# Altium schematic sheet Connector_Section.SchDoc
size A4; DocumentNumber: 6; SheetNumber: 6; SheetTotal: 6
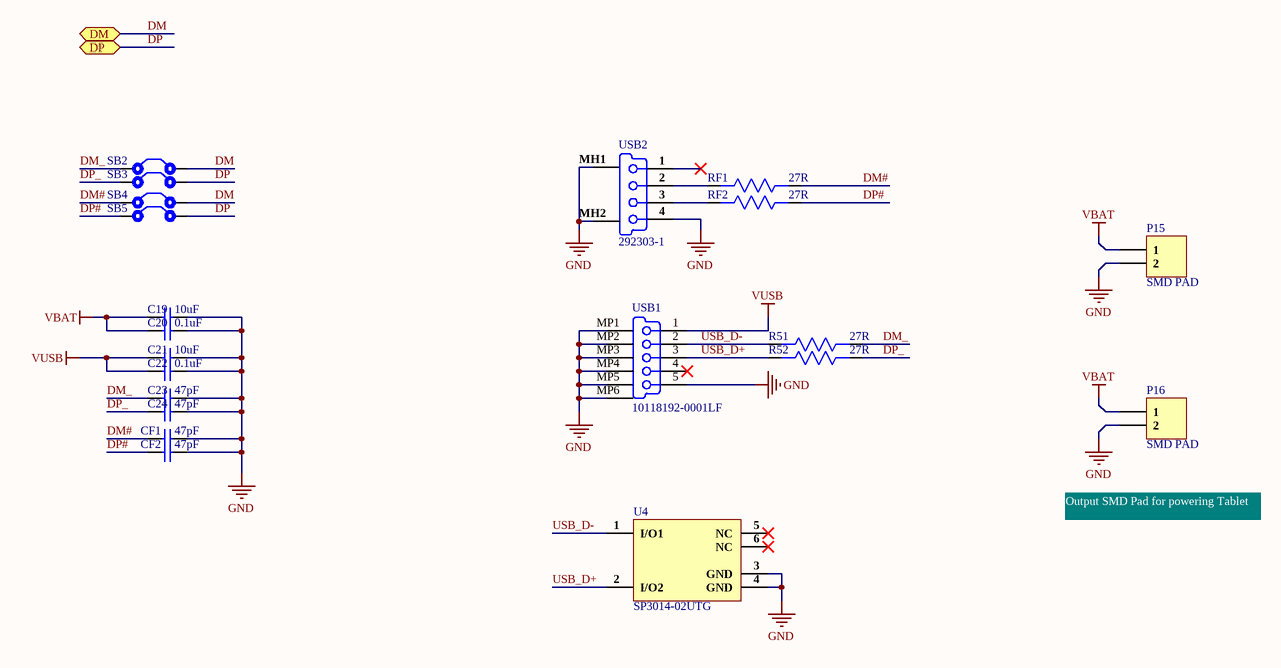
[diagram p0: Connector_Section.SchDoc]

## Parts
C19  10uF  [Cap0402]
C20  0.1uF  [Cap0402]
C21  10uF  [Cap0402]
C22  0.1uF  [Cap0402]
C23  47pF  [Cap0402]
C24  47pF  [Cap0402]
CF1  47pF  [Cap0402]
CF2  47pF  [Cap0402]
P15  SMD PAD  [Solder Bridge]
P16  SMD PAD  [Solder Bridge]
R51  27R  [Res0402]
R52  27R  [Res0402]
RF1  27R  [Res0402]
RF2  27R  [Res0402]
SB2  Solder Bridge  [Solder Bridge]  (value not drawn)
SB3  Solder Bridge  [Solder Bridge]  (value not drawn)
SB4  Solder Bridge  [Solder Bridge]  (value not drawn)
SB5  Solder Bridge  [Solder Bridge]  (value not drawn)
U4  SP3014-02UTG  [SP3014-02UTG]
USB1  10118192-0001LF  [Micro Usb Conn SMD]
USB2  292303-1  [292303-1]

## Ports
DM (bidir), DP (bidir)

## Nets
GND: C19.2 C20.2 C21.2 C22.2 C23.2 C24.2 CF1.2 CF2.2 P15.2 P16.2 U4.3(GND) U4.4(GND) USB1.5(GND) USB1.MP1(Tab) USB1.MP2(Tab) USB1.MP3(Tab) USB1.MP4(Tab) USB1.MP5(Tab) USB1.MP6(Tab) USB2.4(NC) USB2.MH1(Tab) USB2.MH2(Tab)
VBAT: C19.1 C20.1 P15.1 P16.1
VUSB: C21.1 C22.1 USB1.1(V_BUS_(5V))
DM: SB2.2 SB4.2 ; port DM
DM#: CF1.1 RF1.1 SB4.1
DM_: C23.1 R51.1 SB2.1
DP: SB3.2 SB5.2 ; port DP
DP#: CF2.1 RF2.1 SB5.1
DP_: C24.1 R52.1 SB3.1
USB_D+: R52.2 U4.2(I/O2) USB1.3(D+)
USB_D-: R51.2 U4.1(I/O1) USB1.2(D-)
NetRF1_2: RF1.2 USB2.2(D-)
NetRF2_2: RF2.2 USB2.3(D+)

Not connected (* = marked no-connect by the designer): U4 5(NC)* 6(NC)*; USB1 4(NC)*; USB2 1(V_BUS_(5V))*

## Notes on the sheet
- Output SMD Pad for powering Tablet

## Library data of the parts
C19 C21 = CL05A106MP8NUB8: CAP CER 10UF 10V X5R 0402; Manufacturer: Samsung; Tolerance: 20%; Supplier 1: Digi-Key; Manufacturer Part Number: CL05A106MP8NUB8; Stock 1: 1792112; Pricing 1: 1=0.4, 10=0.278, 50=0.1948, 100=0.167, 500=0.12528, 1000=0.1058, 2500=0.10023 (USD); Mount: Surface Mount; Case/Package: 0402; Case Code (Metric): 1005; Case Code (Imperial): 0402; Min Operating Temperature: -55°C; Max Operating Temperature: 85°C; Packaging: Tape and Reel; Capacitance: 10uF; Voltage Rating: 10V; Length: 0.039inch; Width: 0.02inch; Thickness: 0.035inch; ComponentLink1URL: http://www.samsungsem.com/kr/support/product-search/mlcc/CL05A106MP8NUB8.jsp?src-supplier=Digi-Key; ComponentLink1Description: http://www.samsungsem.com/kr/support/product-search/mlcc/CL05A106MP8NUB8.jsp?src-supplier=Digi-Key; Supplier Part Number 1: 1276-6830-1-ND
C20 C22 = CC0402KRX7R7BB104: CAP CER 0.1UF 16V X7R 0402; Manufacturer: Yageo; Tolerance: 10%; Capacitance: 100nF; Supplier 1: Digi-Key; Manufacturer Part Number: CC0402KRX7R7BB104; Stock 1: 16982736; Pricing 1: 1=0.1, 10=0.034, 100=0.015, 500=0.0107, 1000=0.00841, 2500=0.00764, 5000=0.00703 (USD); Mount: Surface Mount; Case/Package: 0402; Number of Pins: 2; Case Code (Metric): 1005; Case Code (Imperial): 0402; Min Operating Temperature: -55°C; Max Operating Temperature: 125°C; Dielectric: X7R; Voltage Rating: 16V; Voltage Rating (DC): 16V; Packaging: Tape and Reel; Package Quantity: 1; Termination: SMD/SMT; Composition: Ceramic; Voltage: 16V; Length: 1mm; Height: 0.5mm; Width: 0.02inch; Thickness: 0.022inch; Depth: 0.5mm; Radiation Hardening: No; REACH SVHC: No SVHC; Lead Free: Lead Free; Halogen Free: Halogen Free; ComponentLink1URL: http://www.yageo.com/documents/recent/UPY-GPHC_X7R_6.3V-to-50V_8.pdf?src-supplier=Avnet+Europe; ComponentLink1Description: http://www.yageo.com/documents/recent/UPY-GPHC_X7R_6.3V-to-50V_8.pdf?src-supplier=Avnet+Europe; ComponentLink2URL: http://www.yageo.com/documents/recent/UPY-GPHC_X7R_6.3V-to-50V_18.pdf?src-supplier=Digi-Key; ComponentLink2Description: http://www.yageo.com/documents/recent/UPY-GPHC_X7R_6.3V-to-50V_18.pdf?src-supplier=Digi-Key; ComponentLink3URL: http://www.yageo.com/documents/recent/UPY-GPHC_X7R_6.3V-to-50V_8.pdf?src-supplier=Avnet; ComponentLink3Description: http://www.yageo.com/documents/recent/UPY-GPHC_X7R_6.3V-to-50V_8.pdf?src-supplier=Avnet; ComponentLink4URL: http://www.yageo.com/documents/recent/UPY-GPHC_X7R_6.3V-to-50V_18.pdf?src-supplier=Mouser; ComponentLink4Description: http://www.yageo.com/documents/recent/UPY-GPHC_X7R_6.3V-to-50V_18.pdf?src-supplier=Mouser; ComponentLink5URL: http://www.farnell.com/datasheets/2167236.pdf?src-supplier=Element14; ComponentLink5Description: http://www.farnell.com/datasheets/2167236.pdf?src-supplier=Element14; ComponentLink6URL: http://www.farnell.com/datasheets/1489800.pdf?src-supplier=Element14; ComponentLink6Description: http://www.farnell.com/datasheets/1489800.pdf?src-supplier=Element14; Supplier Part Number 1: 311-1338-1-ND
C23 C24 CF1 CF2 = GCM1555C1H470JA16D: CAP CER 47PF 50V C0G/NP0 0402; Manufacturer: Murata; Tolerance: 5%; Supplier 1: Digi-Key; Manufacturer Part Number: GCM1555C1H470JA16D; Stock 1: 692165; Pricing 1: 1=0.1, 10=0.059, 50=0.0324, 100=0.0265, 500=0.01892, 1000=0.01487, 2500=0.01352, 5000=0.01244 (USD); Mount: Surface Mount; Case/Package: 0402; Case Code (Metric): 1005; Case Code (Imperial): 0402; Min Operating Temperature: -55°C; Max Operating Temperature: 125°C; Packaging: Cut Tape; Capacitance: 47pF; Voltage Rating: 50V; Length: 0.039inch; Width: 0.02inch; Thickness: 0.022inch; Ratings: AEC-Q200; Lead Free: Lead Free; ComponentLink1URL: https://www.murata.com/~/media/webrenewal/support/library/catalog/products/capacitor/mlcc/c03e.ashx?la=en-us&src-supplier=Digi-Key; ComponentLink1Description: https://www.murata.com/~/media/webrenewal/support/library/catalog/products/capacitor/mlcc/c03e.ashx?la=en-us&src-supplier=Digi-Key; ComponentLink2URL: http://www.mouser.com/ds/2/281/c03e-806517.pdf?src-supplier=Mouser; ComponentLink2Description: http://www.mouser.com/ds/2/281/c03e-806517.pdf?src-supplier=Mouser; ComponentLink3URL: http://psearch.en.murata.com/capacitor/product/GCM1555C1H470JA16%23.pdf?src-supplier=Avnet; ComponentLink3Description: http://psearch.en.murata.com/capacitor/product/GCM1555C1H470JA16%23.pdf?src-supplier=Avnet; Supplier Part Number 1: 490-10670-1-ND
P15 P16 = SMD PAD: Wire connecting Pads
R51 R52 RF1 RF2 = RT0402FRE0727RL: RES SMD 27 OHM 1% 1/16W 0402; Manufacturer: Yageo; Power Rating: 62.5mW; Voltage Rating: 50V; Max Power Dissipation: 63mW; Temperature Coefficient: 50ppm/°C; Supplier 1: Digi-Key; Manufacturer Part Number 1: RT0402FRE0727RL; Stock 1: 26946; Pricing 1: 1=0.1, 10=0.072, 100=0.0277, 1000=0.0122, 2500=0.0105, 5000=0.0094 (USD); Case/Package: 0402; Case Code (Metric): 1005; Case Code (Imperial): 0402; Min Operating Temperature: -55°C; Max Operating Temperature: 125°C; Resistance: 27R; Tolerance: 1%; Packaging: Tape and Reel; Package Quantity: 10000; Composition: Thin Film; Number of Terminations: 2; Termination: SMD/SMT; Military Standard: Not; Voltage Rating (DC): 50V; Features: Moisture Resistant; Length: 1mm; Height: 0.014inch; Width: 0.02inch; Depth: 0.5mm; Lead Free: Lead Free; ComponentLink1URL: http://www.yageo.com/NewPortal/yageodocoutput?fileName=/pdf/R-Chip/PYu-RT_1-to-0.05_RoHS_L_5.pdf&src-supplier=Digi-Key; ComponentLink1Description: http://www.yageo.com/NewPortal/yageodocoutput?fileName=/pdf/R-Chip/PYu-RT_1-to-0.05_RoHS_L_5.pdf&src-supplier=Digi-Key; ComponentLink2URL: http://www.mouser.com/ds/2/447/yageodocoutput-1125656.pdf?src-supplier=Mouser; ComponentLink2Description: http://www.mouser.com/ds/2/447/yageodocoutput-1125656.pdf?src-supplier=Mouser; Supplier Part Number 1: YAG3343CT-ND
SB2-SB5 = Solder Bridge: Solder Bridge ON
U4 = SP3014-02UTG: TVS DIODE 5V 6.8V 6UDFN; Manufacturer: Littelfuse; Capacitance: 1E-12F; Number of Bidirectional Channels: 2; Power Line Protection: Yes; Polarity: Unidirectional; Max Surge Current: 8A; Supplier 1: Digi-Key; Manufacturer Part Number: SP3014-02UTG; Stock 1: 3888; Pricing 1: 1=0.56, 10=0.495, 25=0.4652, 100=0.3375, 250=0.32552, 500=0.282, 1000=0.24 (USD); Mount: Surface Mount; Number of Pins: 6; Min Operating Temperature: -40°C; Max Operating Temperature: 125°C; Packaging: Tape and Reel; Reverse Standoff Voltage: 5V; Clamping Voltage: 6.8V; Termination: SMD/SMT; Number of Channels: 2; Working Voltage: 5V; Package Quantity: 3000; Peak Pulse Current: 8A; Length: 1.65mm; Height: 0.55mm; Width: 1.05mm; ComponentLink1URL: http://www.mouser.com/ds/2/240/Littelfuse_TVS_Diode_Array_SP3014_Datasheet.pdf-364113.pdf?src-supplier=Mouser; ComponentLink1Description: http://www.mouser.com/ds/2/240/Littelfuse_TVS_Diode_Array_SP3014_Datasheet.pdf-364113.pdf?src-supplier=Mouser; ComponentLink2URL: https://www.littelfuse.com/~/media/electronics/datasheets/tvs_diode_arrays/littelfuse_tvs_diode_array_sp3014_datasheet.pdf.pdf?src-supplier=Digi-Key; ComponentLink2Description: https://www.littelfuse.com/~/media/electronics/datasheets/tvs_diode_arrays/littelfuse_tvs_diode_array_sp3014_datasheet.pdf.pdf?src-supplier=Digi-Key; ComponentLink3URL: http://www.littelfuse.com/~/media/electronics/datasheets/tvs_diode_arrays/littelfuse_tvs_diode_array_sp3014_datasheet.pdf.pdf?src-supplier=Digi-Key; ComponentLink3Description: http://www.littelfuse.com/~/media/electronics/datasheets/tvs_diode_arrays/littelfuse_tvs_diode_array_sp3014_datasheet.pdf.pdf?src-supplier=Digi-Key; ComponentLink4URL: http://www.farnell.com/datasheets/2291833.pdf?src-supplier=Element14; ComponentLink4Description: http://www.farnell.com/datasheets/2291833.pdf?src-supplier=Element14; ComponentLink5URL: http://www.farnell.com/datasheets/2291833.pdf?src-supplier=Farnell; ComponentLink5Description: http://www.farnell.com/datasheets/2291833.pdf?src-supplier=Farnell; ComponentLink6URL: http://www.farnell.com/datasheets/2291833.pdf?src-supplier=Newark; ComponentLink6Description: http://www.farnell.com/datasheets/2291833.pdf?src-supplier=Newark; Supplier Part Number 1: F6501DKR-ND
USB1 = 10118192-0001LF: CONN USB MICRO B RECPT SMT R/A; Manufacturer: Amphenol FCI; Gender: Receptacle; Current Rating: 1.8A; Connector Type: USB,Receptacle; Number of Contacts: 5; Insulation Resistance: 1GR; Number of Ports: 1; Max Voltage Rating (AC): 100V; USB Standard: USB 2.0; Pitch: 0.65mm; Supplier 1: Digi-Key; Manufacturer Part Number: 10118192-0001LF; Stock 1: 203283; Pricing 1: 1=0.42, 10=0.393, 25=0.3536, 50=0.3144, 100=0.3013, 250=0.2751, 500=0.262 (USD); Mount: Surface Mount,Horizontal; Contact Material: Copper Alloy; Contact Plating: Nickel,Gold; Colour: Black; Number of Terminals: 5; Housing Material: Polymer; Min Operating Temperature: -55°C; Max Operating Temperature: 85°C; Termination: Solder; Orientation: Right Angle; Packaging: Tape and Reel; Package Quantity: 1400; Voltage Rating: 100V; Length: 7.86mm; Depth: 5.57mm; Radiation Hardening: No; Lead Free: Lead Free; Flammability Rating: UL94 V-0; REACH SVHC: No SVHC; ComponentLink1URL: https://datasheet.ciiva.com/26853/getdatasheetpartid-418041-26853891.pdf; ComponentLink1Description: https://datasheet.ciiva.com/26853/getdatasheetpartid-418041-26853891.pdf; ComponentLink2URL: https://datasheet.ciiva.com/851/10118192-851112.pdf; ComponentLink2Description: https://datasheet.ciiva.com/851/10118192-851112.pdf; ComponentLink3URL: https://datasheet.ciiva.com/4598/10118192ac-197249-4598796.pdf; ComponentLink3Description: https://datasheet.ciiva.com/4598/10118192ac-197249-4598796.pdf; Supplier Part Number 1: 609-4613-1-ND
USB2 = 292303-1: USB-A (USB TYPE-A) USB 2.0 Receptacle Connector 4 Position Through Hole, Right Angle; Manufacturer: TE Connectivity; Plating: Bright,Tin; Number of Positions: 4; Number of Ports: 1; Plating Thickness: 0.76um; Contact Current Rating: 1A; Circuit Application: Signal; Connector System: Cable-to-Board; USB Standard: USB 2.0; Insulation Resistance: 1GR; Voltage Rating (AC): 30V; Pitch: 2.5mm; PCB Thickness: 0.062inch; Tail Length: 0.112inch; Approvals: UL; Supplier 1: Digi-Key; Manufacturer Part Number: 292303-1; Stock 1: 19088; Pricing 1: 1=1.49, 10=1.354, 25=1.2716, 50=1.2162, 100=1.161, 250=1.0504, 500=0.96748, 1000=0.82926, 2500=0.77398 (USD); Mount: Through Hole,Horizontal; Contact Plating: Gold; Housing Material: Thermoplastic; Housing Color: Black; Contact Material: Copper Alloy,Copper; Number of Terminals: 4; Color: Black; Min Operating Temperature: -67°C; Max Operating Temperature: 185°C; Packaging: Rail/Tube; Package Quantity: 30; Termination: Through Hole; Gender: Receptacle; Connector Type: Receptacle; Orientation: Right Angle; Number of Contacts: 4; Current Rating: 1A; Length: 14.63mm; Depth: 14mm; REACH SVHC: No SVHC; Flammability Rating: UL94 V-0; Halogen Free: Halogen Free; ComponentLink1URL: http://www.farnell.com/datasheets/1699414.pdf?src-supplier=Farnell; ComponentLink1Description: http://www.farnell.com/datasheets/1699414.pdf?src-supplier=Farnell; ComponentLink2URL: http://www.te.com/commerce/DocumentDelivery/DDEController?Action=showdoc&DocId=Data+Sheet%7F1-1773453-6%7F0908%7Fpdf%7FEnglish%7FENG_DS_1-1773453-6_0908.pdf&src-supplier=Avnet; ComponentLink2Description: http://www.te.com/commerce/DocumentDelivery/DDEController?Action=showdoc&DocId=Data+Sheet%7F1-1773453-6%7F0908%7Fpdf%7FEnglish%7FENG_DS_1-1773453-6_0908.pdf&src-supplier=Avnet; ComponentLink3URL: http://www.te.com/commerce/DocumentDelivery/DDEController?Action=showdoc&DocId=Data+Sheet1-1773453-60908pdfEnglishENG_DS_1-1773453-6_0908.pdf&src-supplier=Avnet+Asia; ComponentLink3Description: http://www.te.com/commerce/DocumentDelivery/DDEController?Action=showdoc&DocId=Data+Sheet1-1773453-60908pdfEnglishENG_DS_1-1773453-6_0908.pdf&src-supplier=Avnet+Asia; ComponentLink4URL: https://www.te.com/commerce/DocumentDelivery/DDEController?Action=srchrtrv&DocNm=292303&DocType=Customer+Drawing&DocLang=English&src-supplier=Digi-Key; ComponentLink4Description: https://www.te.com/commerce/DocumentDelivery/DDEController?Action=srchrtrv&DocNm=292303&DocType=Customer+Drawing&DocLang=English&src-supplier=Digi-Key; ComponentLink5URL: http://www.farnell.com/datasheets/1699414.pdf?src-supplier=Element14; ComponentLink5Description: http://www.farnell.com/datasheets/1699414.pdf?src-supplier=Element14; ComponentLink6URL: http://www.farnell.com/cad/1699210.pdf?src-supplier=Element14; ComponentLink6Description: http://www.farnell.com/cad/1699210.pdf?src-supplier=Element14; ComponentLink7URL: https://www.alliedelec.com/m/d/b8ff6cd1157c72c7c4c41b4704d2a2e6.pdf?src-supplier=Allied+Electronics; ComponentLink7Description: https://www.alliedelec.com/m/d/b8ff6cd1157c72c7c4c41b4704d2a2e6.pdf?src-supplier=Allied+Electronics; ComponentLink8URL: http://www.te.com/commerce/DocumentDelivery/DDEController?Action=showdoc&DocId=Data+Sheet%7F1-1773453-6%7F0908%7Fpdf%7FEnglish%7FENG_DS_1-1773453-6_0908.pdf&src-supplier=Avnet+Europe; ComponentLink8Description: http://www.te.com/commerce/DocumentDelivery/DDEController?Action=showdoc&DocId=Data+Sheet%7F1-1773453-6%7F0908%7Fpdf%7FEnglish%7FENG_DS_1-1773453-6_0908.pdf&src-supplier=Avnet+Europe; ComponentLink9URL: https://www.distrelec.biz/Web/Downloads/07/08/04270708.pdf?mime=application%2Fpdf&src-supplier=Distrelec; ComponentLink9Description: https://www.distrelec.biz/Web/Downloads/07/08/04270708.pdf?mime=application%2Fpdf&src-supplier=Distrelec; ComponentLink10URL: http://www.jameco.com/Jameco/Products/ProdDS/921651.pdf?src-supplier=Jameco; ComponentLink10Description: http://www.jameco.com/Jameco/Products/ProdDS/921651.pdf?src-supplier=Jameco; ComponentLink11URL: http://www.onlinecomponents.com/productFiles/mf-AMP/ddecontrolleractionsrchrtrvdocnm117734536doctypedsdoclan.pdf?src-supplier=Onlinecomponents.com; ComponentLink11Description: http://www.onlinecomponents.com/productFiles/mf-AMP/ddecontrolleractionsrchrtrvdocnm117734536doctypedsdoclan.pdf?src-supplier=Onlinecomponents.com; ComponentLink12URL: http://www.te.com/commerce/DocumentDelivery/DDEController?Action=showdoc&DocId=Customer+Drawing%7F292303%7FE7%7Fpdf%7FEnglish%7FENG_CD_292303_E7.pdf%7F292303-1&src-supplier=Future+Electronics; ComponentLink12Description: http://www.te.com/commerce/DocumentDelivery/DDEController?Action=showdoc&DocId=Customer+Drawing%7F292303%7FE7%7Fpdf%7FEnglish%7FENG_CD_292303_E7.pdf%7F292303-1&src-supplier=Future+Electronics; Supplier Part Number 1: A31726-ND